# Altium schematic sheet Sheet_1_2026-10-25.schdoc
size 357 x 174 mm
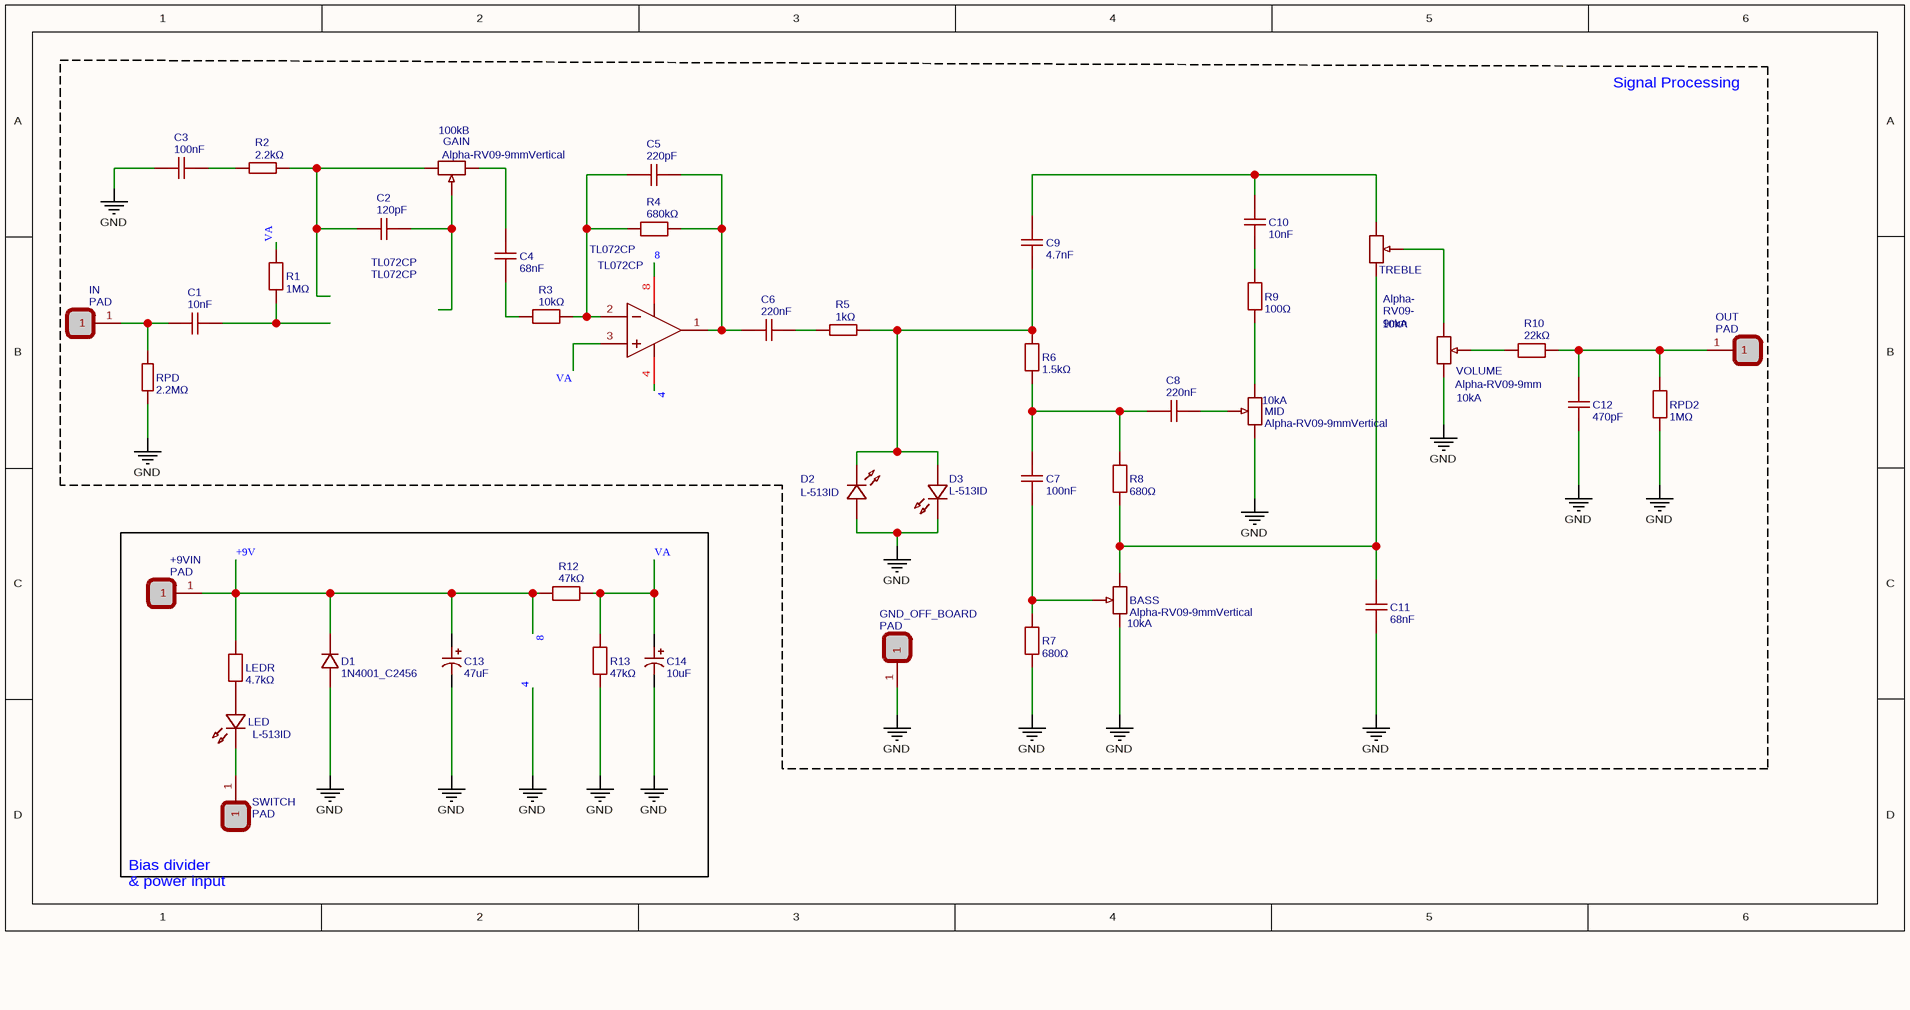
[diagram p0: Sheet_1_2026-10-25.schdoc]

## Parts
(Parts that share a designator on the sheet are numbered #1, #2 ... from top to bottom, then left to right.)
+9VIN  PAD  [SPACER]
BASS  Alpha-RV09-9mmVertical  [ALPHA9MM]
C1  10nF  [CAP-TH_L12.0-W4.5-P10.00-D0.6]
C2  120pF  [CAP-TH_L5.0-W3.2-P5.08-D0.6]
C3  100nF  [CAP-TH_L7.2-W2.5-P5.00-D0.5]
C4  68nF  [CAP-TH_L12.0-W5.0-P10.00-D1.0]
C5  220pF  [CAP-TH_L9.0-W5.0-P5.00-D0.6]
C6  220nF  [CAP-TH_L12.0-W6.5-P10.00-D1.0]
C7  100nF  [CAP-TH_L7.2-W2.5-P5.00-D0.5]
C8  220nF  [CAP-TH_L12.0-W6.5-P10.00-D1.0]
C9  4.7nF  [CAP-TH_L12.5-W5.5-P10.00-D0.6]
C10  10nF  [CAP-TH_L12.0-W4.5-P10.00-D0.6]
C11  68nF  [CAP-TH_L12.0-W5.0-P10.00-D1.0]
C12  470pF  [CAP-TH_L7.5-W3.5-P7.50-D0.8-S3.0]
C13  47uF  [CAP-TH_BD6.3-P2.50-D0.5-FD_5]
C14  10uF  [CAP-TH_BD10.0-P5.00-D0.6-FD_8]
D1  1N4001_C2456  [DO-41_BD2.4-L4.7-P8.70-D0.9-RD]
D2  L-513ID  [LED-TH_BD5.9-P2.54-FD-1]
D3  L-513ID  [LED-TH_BD5.9-P2.54-FD-1]
GAIN  Alpha-RV09-9mmVertical  [ALPHA9MM]
GND_OFF_BOARD  PAD  [SPACER]
IN  PAD  [SPACER]
LED  L-513ID  [LED-TH_BD5.9-P2.54-FD-1]
LEDR  4.7kΩ  [RES-TH_BD2.3-L3.7-P7.70-D0.4]
MID  Alpha-RV09-9mmVertical  [ALPHA9MM]
OUT  PAD  [SPACER]
R1  1MΩ  [RES-TH_BD2.4-L6.3-P10.30-D0.6]
R2  2.2kΩ  [RES-TH_BD2.4-L6.3-P10.30-D0.6]
R3  10kΩ  [RES-TH_BD1.8-L3.2-P7.20-D0.4]
R4  680kΩ  [RES-TH_BD2.2-L6.5-P10.50-D0.6]
R5  1kΩ  [RES-TH_BD2.3-L3.7-P7.70-D0.9]
R6  1.5kΩ  [RES-TH_BD2.7-L6.2-P10.20-D0.4]
R7  680Ω  [RES-TH_BD2.3-L3.7-P7.70-D0.9]
R8  680Ω  [RES-TH_BD2.3-L3.7-P7.70-D0.9]
R9  100Ω  [RES-TH_BD2.3-L3.7-P7.70-D0.9]
R10  22kΩ  [RES-TH_BD2.3-L3.7-P7.70-D0.9]
R12  47kΩ  [RES-TH_BD2.3-L3.7-P7.70-D0.9]
R13  47kΩ  [RES-TH_BD2.3-L3.7-P7.70-D0.9]
RPD  2.2MΩ  [RES-TH_BD2.3-L6.5-P10.50-D0.5]
RPD2  1MΩ  [RES-TH_BD2.4-L6.3-P10.30-D0.6]
SWITCH  PAD  [SPACER]
TL072CP#1  TL072CP  [DIP-8_L9.6-W6.4-P2.54-LS7.6-BL-1]
TL072CP#2  TL072CP  [DIP-8_L9.6-W6.4-P2.54-LS7.6-BL-1]
TREBLE  Alpha-RV09-9mm  [ALPHA9MM]  (value not drawn)
VOLUME  Alpha-RV09-9mm  [ALPHA9MM]

## Blocks framed on the sheet
Signal Processing: BASS C1-C12 D2 D3 GAIN GND_OFF_BOARD IN MID OUT R1-R10 RPD RPD2 TL072CP#1 TL072CP#2 TREBLE VOLUME

## Nets
4: BASS.1 C3.1 C11.1 C12.1 C13.2 C14.2 D1.2(A) D2.1(A) D3.2(K) GND_OFF_BOARD.1 MID.1 R7.1 R13.2 RPD.1 RPD2.1 TL072CP#2.4(VCC-) VOLUME.3  [also labelled GND]
+9V: +9VIN.1 C13.1 D1.1(C) LEDR.2 R12.1 TL072CP#2.8(VCC+)  [also labelled 8]
VA: C14.1 R1.2 R12.2 R13.1 TL072CP#2.3(IN1+)
NetBASS_2: BASS.2 C7.1 R7.2
NetBASS_3: BASS.3 C11.2 R8.1 TREBLE.3
NetC1_1: C1.1 IN.1 RPD.2
NetC1_2: C1.2 R1.1
NetC2_1: C2.1 GAIN.3 R2.2
NetC2_2: C2.2 GAIN.2
NetC3_2: C3.2 R2.1
NetC4_1: C4.1 R3.1
NetC4_2: C4.2 GAIN.1
NetC5_1: C5.1 R3.2 R4.1 TL072CP#2.2(IN1-)
NetC5_2: C5.2 C6.1 R4.2 TL072CP#2.1(OUT1)
NetC6_2: C6.2 R5.1
NetC7_2: C7.2 C8.1 R6.1 R8.2
NetC8_2: C8.2 MID.2
NetC9_1: C9.1 D2.2(K) D3.1(A) R5.2 R6.2
NetC9_2: C9.2 C10.2 TREBLE.1
NetC10_1: C10.1 R9.2
NetC12_2: C12.2 OUT.1 R10.2 RPD2.2
NetLED_1: LED.1(A) LEDR.1
NetLED_2: LED.2(K) SWITCH.1
NetMID_3: MID.3 R9.1
NetR10_1: R10.1 VOLUME.2
NetTREBLE_2: TREBLE.2 VOLUME.1

## Notes on the sheet
- (near GAIN) 100kB
- Alpha-
  RV09-
  9mm
- 10kA
- (near MID) 10kA
- (near VOLUME) 10kA
- (near BASS) 10kA
- (near SWITCH) Bias divider
  & power input

## Library data of the parts
+9VIN GND_OFF_BOARD IN OUT SWITCH = PAD: Manufacturer: 1P Spacer; Manufacturer Part: 1P Spacer; Supplier: Master; Supplier Part: 1P Spacer; spicePre: J; spiceSymbolName: SPACERNEWER
BASS GAIN MID = Alpha-RV09-9mmVertical: Manufacturer: Alpha; Contributor: Jason Chang; Supplier: Mouser; spicePre: V; spiceSymbolName: Alpha-RV09-9mmVertical
C1 C10 = 10nF: Manufacturer: KNSCHA(科尼盛); Manufacturer Part: MPP103J2J10KN22692; nameAlias: Value; Contributor: lcsc; Supplier: LCSC; Supplier Part: C2831910; JLCPCB Part Class: Extended Part; spicePre: U; spiceSymbolName: MPP103J2J10KN22692
C2 = 120pF: Manufacturer: Dersonic(德尔创); Manufacturer Part: CD1H121JC9BECHE100; nameAlias: Value; Contributor: lcsc; Supplier: LCSC; Supplier Part: C2761741; JLCPCB Part Class: Extended Part; spicePre: C; spiceSymbolName: CD1H121JC9BECHE100
C3 C7 = 100nF: Manufacturer: KEMET(基美); Manufacturer Part: R82DC3100DQ50J; nameAlias: Value; Contributor: lcsc; Supplier: LCSC; Supplier Part: C600429; JLCPCB Part Class: Extended Part; spicePre: C; spiceSymbolName: R82DC3100DQ50J
C4 C11 = 68nF: Manufacturer: KYET(科雅); Manufacturer Part: KP683J2J1007; nameAlias: Value; Contributor: LCSC; Supplier: LCSC; Supplier Part: C390079; JLCPCB Part Class: Extended Part; spicePre: C; spiceSymbolName: KP683J2J1007
C5 = 220pF: Manufacturer: TDK; Manufacturer Part: CC45SL3AD221JYVNA; Contributor: lcsc; nameAlias: Value; Supplier: LCSC; Supplier Part: C5331066; JLCPCB Part Class: Extended Part; spicePre: U; spiceSymbolName: CC45SL3AD221JYVNA
C6 C8 = 220nF: Manufacturer: KNSCHA(科尼盛); Manufacturer Part: MPP224J2J10NN22600; nameAlias: Value; Contributor: LCSC; Supplier: LCSC; Supplier Part: C506861; JLCPCB Part Class: Extended Part; spicePre: C; spiceSymbolName: MPP224J2J10NN22600
C9 = 4.7nF: Manufacturer: WEIDY(纬迪); Manufacturer Part: W312J472JK6L00A00C; nameAlias: Value; Contributor: lcsc; Supplier: LCSC; Supplier Part: C21390185; JLCPCB Part Class: Extended Part; spicePre: C; spiceSymbolName: W312J472JK6L00A00C
C12 = 470pF: Manufacturer: DGCX(成希); Manufacturer Part: DGCXY2075Y5P1E471K; nameAlias: Value; Contributor: lcsc; Supplier: LCSC; Supplier Part: C42381413; JLCPCB Part Class: Extended Part; spicePre: C; spiceSymbolName: DGCXY2075Y5P1E471K
C13 = 47uF: Manufacturer: JIERR(捷而瑞); Manufacturer Part: KS50V47M6X11; nameAlias: Value; Contributor: lcsc; Supplier: LCSC; Supplier Part: C54780427; JLCPCB Part Class: Extended Part; spicePre: C; spiceSymbolName: KS50V47M6X11
C14 = 10uF: Manufacturer: TOPAZCON(黄宝石); Manufacturer Part: ERF2W100M101600Y; nameAlias: Value; Contributor: lcsc; Supplier: LCSC; Supplier Part: C55265379; JLCPCB Part Class: Extended Part; spicePre: C; spiceSymbolName: ERF2W100M101600Y
D1 = 1N4001_C2456: Manufacturer: MDD(辰达半导体); Manufacturer Part: 1N4001; Supplier: LCSC; Supplier Part: C2456; JLCPCB Part Class: Extended Part; spicePre: D; spiceSymbolName: 1N4001_C2456
D2 D3 LED = L-513ID: Manufacturer: PARALIGHT(光鼎); Contributor: lcsc; Supplier: LCSC; Supplier Part: C2895168; Manufacturer Part: L-513ID; JLCPCB Part Class: Extended Part; spicePre: L; spiceSymbolName: L-513ID
LEDR = 4.7kΩ: Manufacturer: VO(翔胜); Manufacturer Part: CR1/8W-4K7±5%-ST26; Contributor: lcsc; nameAlias: Value; Supplier: LCSC; Supplier Part: C2897062; JLCPCB Part Class: Extended Part; spicePre: U; spiceSymbolName: CR1/8W-4K7±5%-ST26
R1 RPD2 = 1MΩ: Manufacturer: YAGEO(国巨); Manufacturer Part: FMP100JR-52-1M; nameAlias: Value; Contributor: lcsc; Supplier: LCSC; Supplier Part: C1740216; JLCPCB Part Class: Extended Part; spicePre: R; spiceSymbolName: FMP100JR-52-1M
R2 = 2.2kΩ: Manufacturer: YAGEO(国巨); Manufacturer Part: MFR50SFTE52-2K2; nameAlias: Value; Contributor: LCSC; Supplier: LCSC; Supplier Part: C173151; JLCPCB Part Class: Extended Part; spicePre: R; spiceSymbolName: MFR50SFTE52-2K2
R3 = 10kΩ: Manufacturer: SEI(Stackpole Electronics Inc.); Manufacturer Part: RNMF14FTC10K0; Contributor: lcsc; nameAlias: Value; Supplier: LCSC; Supplier Part: C2441627; JLCPCB Part Class: Extended Part; spicePre: U; spiceSymbolName: RNMF14FTC10K0
R4 = 680kΩ: Manufacturer: UNI-ROYAL(厚声); Manufacturer Part: MGR0W4F6803A40; nameAlias: Value; Contributor: lcsc; Supplier: LCSC; Supplier Part: C52763190; JLCPCB Part Class: Extended Part; spicePre: R; spiceSymbolName: MGR0W4F6803A40
R5 = 1kΩ: Manufacturer: VO(翔胜); Manufacturer Part: CR1/8W-1K±5%-ST26; Contributor: lcsc; nameAlias: Value; Supplier: LCSC; Supplier Part: C2896954; JLCPCB Part Class: Extended Part; spicePre: R; spiceSymbolName: CR1/8W-1K±5%-ST26
R6 = 1.5kΩ: Manufacturer: VO(翔胜); Manufacturer Part: CR1/4W-1K5±5%-ST52; Contributor: lcsc; nameAlias: Value; Supplier: LCSC; Supplier Part: C2894662; JLCPCB Part Class: Extended Part; spicePre: R; spiceSymbolName: CR1/4W-1K5±5%-ST52
R7 R8 = 680Ω: Manufacturer: VO(翔胜); Manufacturer Part: CR1/8W-680Ω±5%-ST26; Contributor: lcsc; nameAlias: Value; Supplier: LCSC; Supplier Part: C2897090; JLCPCB Part Class: Extended Part; spicePre: U; spiceSymbolName: CR1/8W-680Ω±5%-ST26
R9 = 100Ω: Manufacturer: VO(翔胜); Manufacturer Part: CR1/8W-100Ω±5%-ST52; Contributor: lcsc; nameAlias: Value; Supplier: LCSC; Supplier Part: C2896921; JLCPCB Part Class: Extended Part; spicePre: U; spiceSymbolName: CR1/8W-100Ω±5%-ST52
R10 = 22kΩ: Manufacturer: VO(翔胜); Manufacturer Part: CR1/8W-22K±5%-ST52; Contributor: lcsc; nameAlias: Value; Supplier: LCSC; Supplier Part: C2896978; JLCPCB Part Class: Extended Part; spicePre: R; spiceSymbolName: CR1/8W-22K±5%-ST52
R12 R13 = 47kΩ: Manufacturer: VO(翔胜); Manufacturer Part: CR1/8W-47K±5%-ST52; Contributor: lcsc; nameAlias: Value; Supplier: LCSC; Supplier Part: C2897058; JLCPCB Part Class: Extended Part; spicePre: R; spiceSymbolName: CR1/8W-47K±5%-ST52
RPD = 2.2MΩ: Manufacturer: Tyohm(幸亚电阻); Manufacturer Part: RT 1/4W 2M2 J T/B; Contributor: lcsc; nameAlias: Value; Supplier: LCSC; Supplier Part: C5200510; JLCPCB Part Class: Extended Part; spicePre: U; spiceSymbolName: RT 1/4W 2M2 J T/B
TL072CP#1 = TL072CP: subpart_no: 2; Manufacturer: TI(德州仪器); tags: FET Operational Amplifier; Supplier Part: C7236; Supplier: LCSC; Manufacturer Part: TL072CP; JLCPCB Part Class: Extended Part; spicePre: U; spiceSymbolName: TL072CP
TL072CP#2 = TL072CP: subpart_no: 1; Manufacturer: TI(德州仪器); tags: FET Operational Amplifier; Supplier Part: C7236; Supplier: LCSC; Manufacturer Part: TL072CP; JLCPCB Part Class: Extended Part; spicePre: U; spiceSymbolName: TL072CP
TREBLE VOLUME = Alpha-RV09-9mm: Manufacturer: Alpha; Contributor: Jason Chang; Supplier: Mouser; spicePre: V; spiceSymbolName: Alpha-RV09-9mmVertical